# EasyEDA Pro project P3+KG.epro, schematic Schematic4
Board Name: Board3; Create Date: 2026-06-13; Page Name: P1; Project Name: P3; Schematic Name: Schematic4; Update Date: 2026-06-13; Company: 嘉立创EDA; Page Size: A4; Version: V1.0
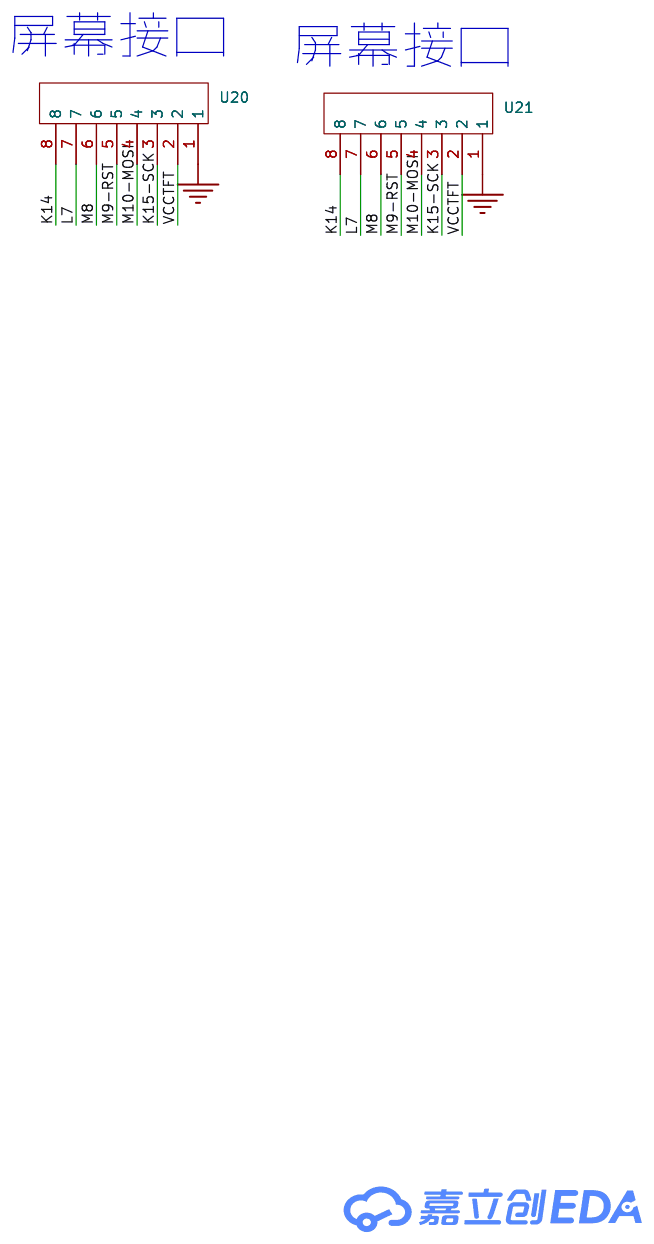
[diagram p6: schematic sheet]

## Parts
U20  -  [HDR-TH_8P-P2.54-V-F-1]
U21  -  [HDR-TH_8P-P2.54-V-F-1]

## Library data of the parts
U20 U21 = TFT1.8单

## Nets
GND: U20.1 U21.1
VCCTFT: U20.2 U21.2
K14: U20.8 U21.8
K15-SCK: U20.3 U21.3
L7: U20.7 U21.7
M8: U20.6 U21.6
M9-RST: U20.5 U21.5
M10-MOSI: U20.4 U21.4

## Notes on the sheet
- 屏幕接口
- 屏幕接口
